# Altium schematic sheet Tank-Level-Sensor-Sheet.SchDoc
size A4; SheetNumber: 8; SheetTotal: 10
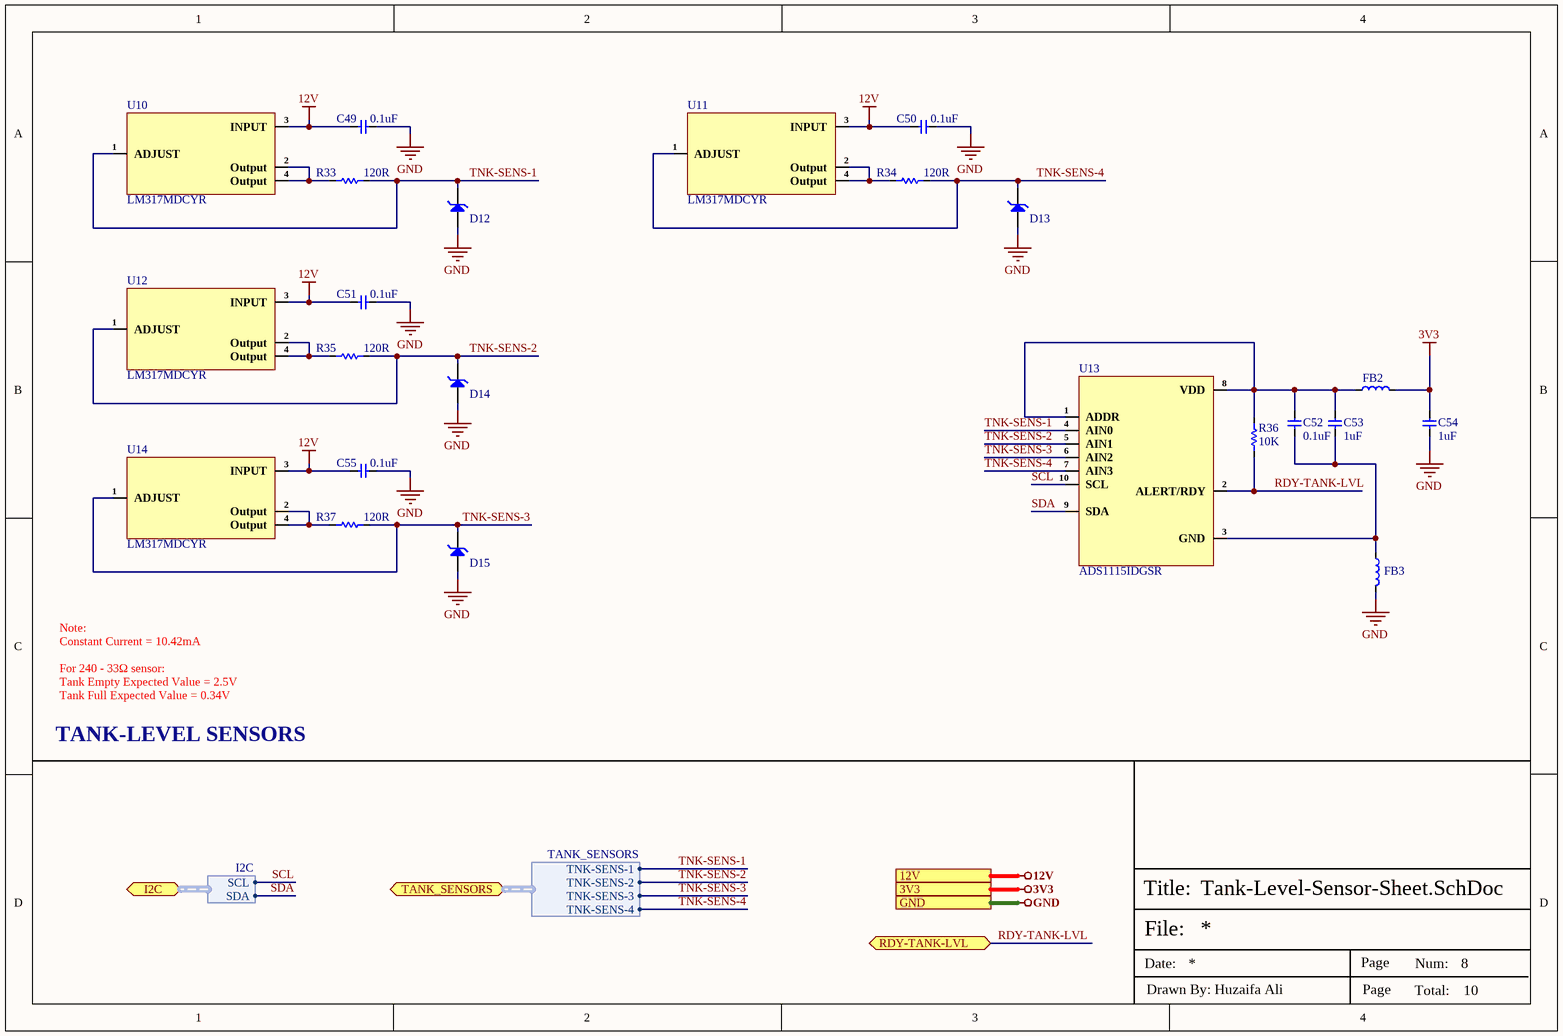
[diagram p0: Tank-Level-Sensor-Sheet.SchDoc]

## Parts
C49  0.1uF  [Cap-0402]
C50  0.1uF  [Cap-0402]
C51  0.1uF  [Cap-0402]
C52  0.1uF  [Cap-0402]
C53  1uF  [Cap-0402]
C54  1uF  [Cap-0402]
C55  0.1uF  [Cap-0402]
D12  MSP3V3HM3/89A  [MicroSMP]  (value not drawn)
D13  MSP3V3HM3/89A  [MicroSMP]  (value not drawn)
D14  MSP3V3HM3/89A  [MicroSMP]  (value not drawn)
D15  MSP3V3HM3/89A  [MicroSMP]  (value not drawn)
FB2  MMZ2012R102ATD25  [Ind-0805]  (value not drawn)
FB3  MMZ2012R102ATD25  [Ind-0805]  (value not drawn)
R33  120R  [Res-0603]
R34  120R  [Res-0603]
R35  120R  [Res-0603]
R36  10K  [Res-0402]
R37  120R  [Res-0603]
U10  LM317MDCYR  [SOT- 223]
U11  LM317MDCYR  [SOT- 223]
U12  LM317MDCYR  [SOT- 223]
U13  ADS1115IDGSR  [VSSOP-10]
U14  LM317MDCYR  [SOT- 223]

## Ports
3V3 (see Top-Sheet[3B], CAN-Transceiver-Sheet[3D], Controller-Sheet[3D], Fuel-Sensor-Sheet[4C], Power-Sheet-2[3D], Storage-Sheet[3D], USB-to-UART-Sheet[3D]), 12V (see Top-Sheet[3B], Power-Sheet-1[3D]), GND (see Top-Sheet[3B], CAN-Transceiver-Sheet[3D], Connector-Sheet[3D], Controller-Sheet[3D], Fuel-Sensor-Sheet[4C], Power-Sheet-1[3D], Power-Sheet-2[3D], Storage-Sheet[3D], USB-to-UART-Sheet[3D]), I2C (bidir, harness I2C, see Top-Sheet[4B], Controller-Sheet[1D], Fuel-Sensor-Sheet[4C]), RDY-TANK-LVL (bidir, see Top-Sheet[3B]), TANK_SENSORS (bidir, harness TANK_SENSORS, see Top-Sheet[4B], Connector-Sheet[1D])

## Harnesses
I2C: SCL, SDA
TANK_SENSORS: TNK-SENS-1, TNK-SENS-2, TNK-SENS-3, TNK-SENS-4

## Nets
3V3: C54.1 FB2.2 ; port 3V3
12V: C49.2 C50.2 C51.2 C55.2 U10.3(INPUT) U11.3(INPUT) U12.3(INPUT) U14.3(INPUT) ; port 12V
GND: C49.1 C50.1 C51.1 C54.2 C55.1 D12.1(A) D13.1(A) D14.1(A) D15.1(A) FB3.2 ; port GND
RDY-TANK-LVL: R36.1 U13.2(ALERT/RDY) ; port RDY-TANK-LVL
SCL: U13.10(SCL) ; port I2C.SCL
SDA: U13.9(SDA) ; port I2C.SDA
TNK-SENS-1: D12.2(K) R33.2 U10.1(ADJUST) U13.4(AIN0) ; port TANK_SENSORS.TNK-SENS-1
TNK-SENS-2: D14.2(K) R35.2 U12.1(ADJUST) U13.5(AIN1) ; port TANK_SENSORS.TNK-SENS-2
TNK-SENS-3: D15.2(K) R37.2 U13.6(AIN2) U14.1(ADJUST) ; port TANK_SENSORS.TNK-SENS-3
TNK-SENS-4: D13.2(K) R34.2 U11.1(ADJUST) U13.7(AIN3) ; port TANK_SENSORS.TNK-SENS-4
NetC52_1: C52.1 C53.1 FB2.1 R36.2 U13.1(ADDR) U13.8(VDD)
NetC52_2: C52.2 C53.2 FB3.1 U13.3(GND)
NetR33_1: R33.1 U10.2(Output) U10.4(Output)
NetR34_1: R34.1 U11.2(Output) U11.4(Output)
NetR35_1: R35.1 U12.2(Output) U12.4(Output)
NetR37_1: R37.1 U14.2(Output) U14.4(Output)

## Notes on the sheet
- Note:
  Constant Current = 10.42mA
  For 240 - 33Ω sensor:
  Tank Empty Expected Value = 2.5V
  Tank Full Expected Value = 0.34V
- TANK-LEVEL SENSORS
- File:
- Title:
- Date:
- Page
- Num:
- Total:
- Drawn By: Huzaifa Ali

## Library data of the parts
C49-C52 C55 = CL05B104KB54PNC: CAP CER 0.1UF 50V X7R 0402; Manufacturer: Samsung; Supplier 1: Digi-Key; Manufacturer Part Number: CL05B104KB54PNC; Stock 1: 8594; Pricing 1: 1=0.1, 10=0.067, 50=0.0366, 100=0.0299, 500=0.02138, 1000=0.01681, 2500=0.01528, 5000=0.01406 (USD); Supplier Part Number 1: 1276-CL05B104KB54PNCDKR-ND; LCSC Part Number: C307331
C53 C54 = CL05A105KA5NQNC: CAP CER 1UF 25V X5R 0402; Manufacturer: Samsung; Material: Ceramic; Tolerance: 10%; Item Type: Capacitor; Supplier 1: Arrow Electronics; Manufacturer Part Number: CL05A105KA5NQNC; RoHS: Yes; Category: Ceramic Capacitors; Stock 1: 80000; Pricing 1: 10000=0.0256, 20000=0.0238, 30000=0.0228, 50000=0.0207, 100000=0.0175, 250000=0.0157 (USD); Mounting Technology: Surface Mount; Case/Package: 0402; Case Code (Metric): 1005; Case Code (Imperial): 0402; Min Operating Temperature: -55°C; Max Operating Temperature: 85°C; Package Quantity: 10000; Series: CL; Voltage Rating: 25V; Packaging: Tape and Reel; Construction: Flat; Value: 1uF; Dielectric: X5R; Length: 1mm; Width: 0.02inch; Height: 0.5mm; Depth: 0.5mm; Thickness: 0.022inch; Radiation Hardening: No; Lead Free: Lead Free; RoHS Compliant: Yes; ComponentLink1URL: https://datasheet.ciiva.com/25720/cl05a105ka5nqnc-25720771.pdf?src-supplier=Digi-Key; ComponentLink1Description: https://datasheet.ciiva.com/25720/cl05a105ka5nqnc-25720771.pdf?src-supplier=Digi-Key; ComponentLink2URL: https://datasheet.ciiva.com/3777/cl05a105ka5nqnc-3777709.pdf?src-supplier=Arrow+Electronics; ComponentLink2Description: https://datasheet.ciiva.com/3777/cl05a105ka5nqnc-3777709.pdf?src-supplier=Arrow+Electronics; ComponentLink3URL: https://datasheet.ciiva.com/29198/459147-da-01-en-vs-kondensator-0402-29198339.pdf?src-supplier=Conrad; ComponentLink3Description: https://datasheet.ciiva.com/29198/459147-da-01-en-vs-kondensator-0402-29198339.pdf?src-supplier=Conrad; Supplier Part Number 1: CL05A105KA5NQNC; LCSC Part Number: C52923
D12-D15 = MSP3V3HM3/89A: TVS DIODE 3.3VWM 11.5VC MICROSMP; Direction: Unidirectional; Operating Supply Voltage: 3.3V; Max Surge Current: 75A; Breakdown Voltage: 4.1V; Clamping Voltage: 11V; Peak Pulse Power: 150W; Number of Unidirectional Channels: 1; Power Line Protection: No; Peak Pulse Current: 87A; Test Current: 1mA; Max Reverse Leakage Current: 200uA; Diode Type: ZENER; LCSC Part Number: C241899; Item Type: TVS Diode; ComponentLink1Description: LCSC; Supplier: Mouser; Supplier Part Number: 625-MSP3V3HM3; RoHS: Yes; Category: TVS Diodes; Stock: 15021; Pricing: 1=0.39, 10=0.313, 50=0.313, 100=0.165, 1000=0.068, 10000=0.05 (USD); Mounting Technology: Surface Mount; Min Operating Temperature: -55°C; Max Operating Temperature: 150°C; Packaging: Tape and Reel; Package Quantity: 4500; Polarity: Unidirectional; Reverse Standoff Voltage: 3.3V; Min Breakdown Voltage: 4.1V; Series: Automotive, AEC-Q101, TransZorb®, eSMP™; RoHS Compliant: Yes; ComponentLink2URL: https://datasheet.ciiva.com/14080/msp3v3-14080471.pdf?src-supplier=Digi-Key; ComponentLink2Description: https://datasheet.ciiva.com/14080/msp3v3-14080471.pdf?src-supplier=Digi-Key
FB2 FB3 = MMZ2012R102ATD25: FERRITE BEAD 1K OHM 0805 1LN; Manufacturer: TDK; Number of Lines: 1; Max Current Rating: 500mA; DC Resistance (DCR): 300mR; Impedance: 1kR; Tolerance: 25%; Test Frequency: 100MHz; Supplier 1: Digi-Key; Manufacturer Part Number: MMZ2012R102ATD25; RoHS: Yes; Category: Ferrite Beads and Chips; Stock 1: 2942; Pricing 1: 1=0.11000, 10=0.09200, 25=0.08280, 50=0.06080, 100=0.05240, 250=0.04140, 500=0.03496, 1000=0.02944 (USD); Mount: Surface Mount; Case/Package: 0805; Case Code (Metric): 2012; Case Code (Imperial): 0805; Weight: 0.000194oz; Min Operating Temperature: -55°C; Max Operating Temperature: 125°C; Package Quantity: 4000; Packaging: Tape and Reel; Termination: SMD/SMT; Max DC Current: 500mA; Length: 0.079inch; Width: 0.049inch; Height: 0.041inch; Ratings: AEC-Q200; RoHS Compliant: Yes; ComponentLink1URL: http://www.mouser.com/ds/2/400/beads_automotive_signal_mmz_en-469244.pdf?src-supplier=Mouser; ComponentLink1Description: http://www.mouser.com/ds/2/400/beads_automotive_signal_mmz_en-469244.pdf?src-supplier=Mouser; ComponentLink2URL: https://product.tdk.com/info/en/catalog/datasheets/beads_automotive_signal_mmz2012_en.pdf?src-supplier=Digi-Key; ComponentLink2Description: https://product.tdk.com/info/en/catalog/datasheets/beads_automotive_signal_mmz2012_en.pdf?src-supplier=Digi-Key; Supplier Part Number 1: 445-MMZ2012R102ATD25CT-ND; LCSC Part Number: C307765; Item Type: Ferrite Bead
R33-R35 R37 = RC0603FR-07120RL: RES 120 OHM 1% 1/10W 0603; Manufacturer: Yageo; Temperature Coefficient: 100ppm/°C; Voltage Rating (DC): 50V; Power Rating: 100mW; Supplier 1: Digi-Key; Manufacturer Part Number: RC0603FR-07120RL; RoHS: Yes; Category: Chip SMD Resistors; Stock 1: 839061; Pricing 1: 1=0.10000, 10=0.02400, 100=0.00970, 1000=0.00436, 2500=0.00378 (USD); Case/Package: 0603; Number of Pins: 2; Case Code (Metric): 1608; Case Code (Imperial): 0603; Size Code: 0603; Min Operating Temperature: -55°C; Max Operating Temperature: 155°C; Resistance: 120R; Tolerance: 1%; Resistor Type: Thick Film; Packaging: Tape and Reel; Voltage Rating: 50V; Package Quantity: 1; Number of Terminations: 2; Termination: SMD/SMT; Max Power Dissipation: 100mW; Features: Moisture Resistant; Series: RC; Construction: Rectangular; Resistance Tolerance: 1%; Length: 1.6mm; Width: 0.031inch; Height: 0.022inch; Depth: 0.8mm; REACH SVHC: No SVHC; Lead Free: Lead Free; Military Standard: Not; RoHS Compliant: Yes; ComponentLink1URL: https://datasheet.ciiva.com/2553/pyu-r-int-thick-7-2553512.pdf?src-supplier=Digi-Key; ComponentLink1Description: https://datasheet.ciiva.com/2553/pyu-r-int-thick-7-2553512.pdf?src-supplier=Digi-Key; ComponentLink2URL: https://datasheet.ciiva.com/7746/443971-7746248.pdf?src-supplier=Element14; ComponentLink2Description: https://datasheet.ciiva.com/7746/443971-7746248.pdf?src-supplier=Element14; ComponentLink3URL: https://datasheet.ciiva.com/2553/pyu-r-int-thick-7-2553513.pdf?src-supplier=Digi-Key; ComponentLink3Description: https://datasheet.ciiva.com/2553/pyu-r-int-thick-7-2553513.pdf?src-supplier=Digi-Key; ComponentLink4URL: https://datasheet.ciiva.com/7746/443971-7746249.pdf?src-supplier=Element14; ComponentLink4Description: https://datasheet.ciiva.com/7746/443971-7746249.pdf?src-supplier=Element14; ComponentLink5URL: https://datasheet.ciiva.com/2553/pyu-r-int-thick-7-2553514.pdf?src-supplier=Digi-Key; ComponentLink5Description: https://datasheet.ciiva.com/2553/pyu-r-int-thick-7-2553514.pdf?src-supplier=Digi-Key; ComponentLink6URL: https://datasheet.ciiva.com/46395/443971-46395021.pdf?src-supplier=Element14; ComponentLink6Description: https://datasheet.ciiva.com/46395/443971-46395021.pdf?src-supplier=Element14; Supplier Part Number 1: 311-120HRCT-ND; LCSC Part Number: C114640
R36 = RC0402FR-0710KL: RES 10K OHM 1% 1/16W 0402; Manufacturer: Yageo; Resistance: 10kR; Voltage Rating (DC): 50V; Temperature Coefficient: 100ppm/°C; Power Rating: 62.5mW; Max Power Dissipation: 63mW; Item Type: Resistor; Supplier 1: Mouser; Manufacturer Part Number: RC0402FR-0710KL; RoHS: Yes; Category: Chip SMD Resistors; Stock 1: 18648329; Pricing 1: 1=0.10000, 10=0.01400, 50=0.01400, 100=0.00500, 1000=0.00300, 10000=0.00200 (USD); Case/Package: 0402; Number of Pins: 2; Case Code (Imperial): 0402; Case Code (Metric): 1005; Min Operating Temperature: -55°C; Max Operating Temperature: 155°C; Resistor Type: Thick Film; Tolerance: 1%; Packaging: Tape and Reel; Voltage Rating: 50V; Termination: SMD/SMT; Working Voltage: 50V; Number of Terminations: 2; Features: Moisture Resistant; Series: RC; Resistance Tolerance: 1%; Construction: Rectangular; Length: 1mm; Width: 0.5mm; Height: 0.32mm; Depth: 0.5mm; Lead Pitch: 0.2mm; REACH SVHC: No SVHC; Lead Free: Lead Free; RoHS Compliant: Yes; Military Standard: Not; ComponentLink1URL: https://datasheet.ciiva.com/7660/38568-7660787.pdf?src-supplier=Element14; ComponentLink1Description: https://datasheet.ciiva.com/7660/38568-7660787.pdf?src-supplier=Element14; ComponentLink2URL: https://datasheet.ciiva.com/7849/1686128-7849814.pdf?src-supplier=Element14; ComponentLink2Description: https://datasheet.ciiva.com/7849/1686128-7849814.pdf?src-supplier=Element14; ComponentLink3URL: https://datasheet.ciiva.com/7983/1018594-7983486.pdf?src-supplier=Element14; ComponentLink3Description: https://datasheet.ciiva.com/7983/1018594-7983486.pdf?src-supplier=Element14; ComponentLink4URL: https://datasheet.ciiva.com/22747/1018594-22747512.pdf?src-supplier=Element14; ComponentLink4Description: https://datasheet.ciiva.com/22747/1018594-22747512.pdf?src-supplier=Element14; ComponentLink5URL: https://datasheet.ciiva.com/12667/pyu-rc0402-51-rohs-l-6-r-12667067.pdf?src-supplier=Mouser; ComponentLink5Description: https://datasheet.ciiva.com/12667/pyu-rc0402-51-rohs-l-6-r-12667067.pdf?src-supplier=Mouser; ComponentLink6URL: https://datasheet.ciiva.com/7849/1784430-7849813.pdf?src-supplier=Element14; ComponentLink6Description: https://datasheet.ciiva.com/7849/1784430-7849813.pdf?src-supplier=Element14; ComponentLink7URL: https://datasheet.ciiva.com/7849/1784430-7849815.pdf?src-supplier=Element14; ComponentLink7Description: https://datasheet.ciiva.com/7849/1784430-7849815.pdf?src-supplier=Element14; Supplier Part Number 1: 603-RC0402FR-0710KL; LCSC Part Number: C60490
U10-U12 U14 = LM317MDCYR: IC REG LIN POS ADJ 500MA SOT223; Manufacturer: Texas Instruments; Output Voltage: 37V; Number of Outputs: 1; Min Input Voltage: 4.2V; Max Supply Voltage: 40V; Polarity: Positive; Min Output Voltage: 1.25V; Quiescent Current: 3.5mA; Output Type: Adjustable; Reference Voltage: 1.3V; Power Supply Rejection Ratio (PSRR): 80dB; Supplier: Mouser; Supplier Part Number: 595-LM317MDCYR; Manufacturer Part Number: LM317MDCYR; RoHS: Yes; Category: Voltage Regulators - Linear; Stock: 12890; Pricing: 1=0.67, 10=0.564, 50=0.564, 100=0.428, 500=0.359, 1000=0.283, 2500=0.263, 5000=0.245, 10000=0.236, 25000=0.227 (USD); Mounting Technology: Surface Mount; Case/Package: SOT-223-4; Pins: 4; Weight: 0.006632oz; Min Operating Temperature: -40°C; Max Operating Temperature: 125°C; Packaging: Tape and Reel; Output Current: 500mA; Number of Regulators: 1; Max Output Voltage: 37V; Package Quantity: 1; Max Output current: 500mA; Series: -; Radiation Hardening: No; Reach SVHC Compliant: No; Lead Free: Lead Free; RoHS Compliant: Yes; ComponentLink1URL: https://datasheet.ciiva.com/1643/755612-1643356.pdf?src-supplier=Newark; ComponentLink1Description: https://datasheet.ciiva.com/1643/755612-1643356.pdf?src-supplier=Newark; ComponentLink2URL: https://datasheet.ciiva.com/41458/001014040-da-01-en-ic-reg-adj-0-5-lm317mdcyr-sot-223-4-tid-41458215.pdf?src-supplier=Conrad; ComponentLink2Description: https://datasheet.ciiva.com/41458/001014040-da-01-en-ic-reg-adj-0-5-lm317mdcyr-sot-223-4-tid-41458215.pdf?src-supplier=Conrad; ComponentLink3URL: https://datasheet.ciiva.com/1512/1814942-1512040.pdf?src-supplier=Element14; ComponentLink3Description: https://datasheet.ciiva.com/1512/1814942-1512040.pdf?src-supplier=Element14; ComponentLink4URL: https://datasheet.ciiva.com/46398/755612-46398903.pdf?src-supplier=Element14; ComponentLink4Description: https://datasheet.ciiva.com/46398/755612-46398903.pdf?src-supplier=Element14; ComponentLink5URL: https://datasheet.ciiva.com/46419/1814942-46419370.pdf?src-supplier=Element14; ComponentLink5Description: https://datasheet.ciiva.com/46419/1814942-46419370.pdf?src-supplier=Element14; ComponentLink6URL: https://datasheet.ciiva.com/2042/lm317m-2042100.pdf?src-supplier=Digikey; ComponentLink6Description: https://datasheet.ciiva.com/2042/lm317m-2042100.pdf?src-supplier=Digikey; ComponentLink7URL: https://datasheet.ciiva.com/2042/lm317m-2042099.pdf?src-supplier=Digikey; ComponentLink7Description: https://datasheet.ciiva.com/2042/lm317m-2042099.pdf?src-supplier=Digikey; ComponentLink8URL: https://datasheet.ciiva.com/2042/lm317m-2042101.pdf?src-supplier=Digikey; ComponentLink8Description: https://datasheet.ciiva.com/2042/lm317m-2042101.pdf?src-supplier=Digikey; ComponentLink9URL: https://datasheet.ciiva.com/14280/lm317mq-14280776.pdf?src-supplier=Avnet; ComponentLink9Description: https://datasheet.ciiva.com/14280/lm317mq-14280776.pdf?src-supplier=Avnet; LCSC Part Number: C840113; Item Type: IC
U13 = ADS1115IDGSR: IC ADC 16BIT SIGMA-DELTA 10VSSOP; Manufacturer: Texas Instruments; Interface: I2C; Number of Bits: 16; Sampling Rate: 860S/s; Number of A/D Converters: 1; Resolution: 16b; Polarity: Bipolar; Min Supply Voltage: 2V; Max Supply Voltage: 5.5V; Supply Type: Single; Conversion Rate: 0.86KS/s; Number of Inputs: 4; Integral Nonlinearity (INL): 1LSB; Power Dissipation: 900uW; Nominal Supply Current: 150uA; Number of Channels: 2; Supplier: Mouser; Supplier Part Number: 595-ADS1115IDGSR; Manufacturer Part Number: ADS1115IDGSR; RoHS: Yes; Category: Analog to Digital Converters (ADCs); Stock: 5925; Pricing: 1=5.44, 10=4.76, 50=4.76, 100=4.01, 1000=2.88, 10000=2.78 (USD); Case/Package: VSSOP; Pins: 10; Contact Plating: Gold; Min Operating Temperature: -40°C; Max Operating Temperature: 125°C; Package Quantity: 2500; Packaging: Tape and Reel; Number of Converters: 1; Max Supply Voltage (DC): 5.5V; Min Supply Voltage (DC): 2V; Series: -; Length: 3mm; Width: 3mm; Height: 1.07mm; Thickness: 1.02mm; Reach SVHC Compliant: No; Lead Free: Lead Free; RoHS Compliant: Yes; ComponentLink1URL: https://datasheet.ciiva.com/4031/47725463s8438921n7713-4031028.pdf?src-supplier=Arrow+Electronics; ComponentLink1Description: https://datasheet.ciiva.com/4031/47725463s8438921n7713-4031028.pdf?src-supplier=Arrow+Electronics; LCSC Part Number: C37593; Item Type: IC